# Altium schematic sheet A313_4.SchDoc
size 817 x 513 mm
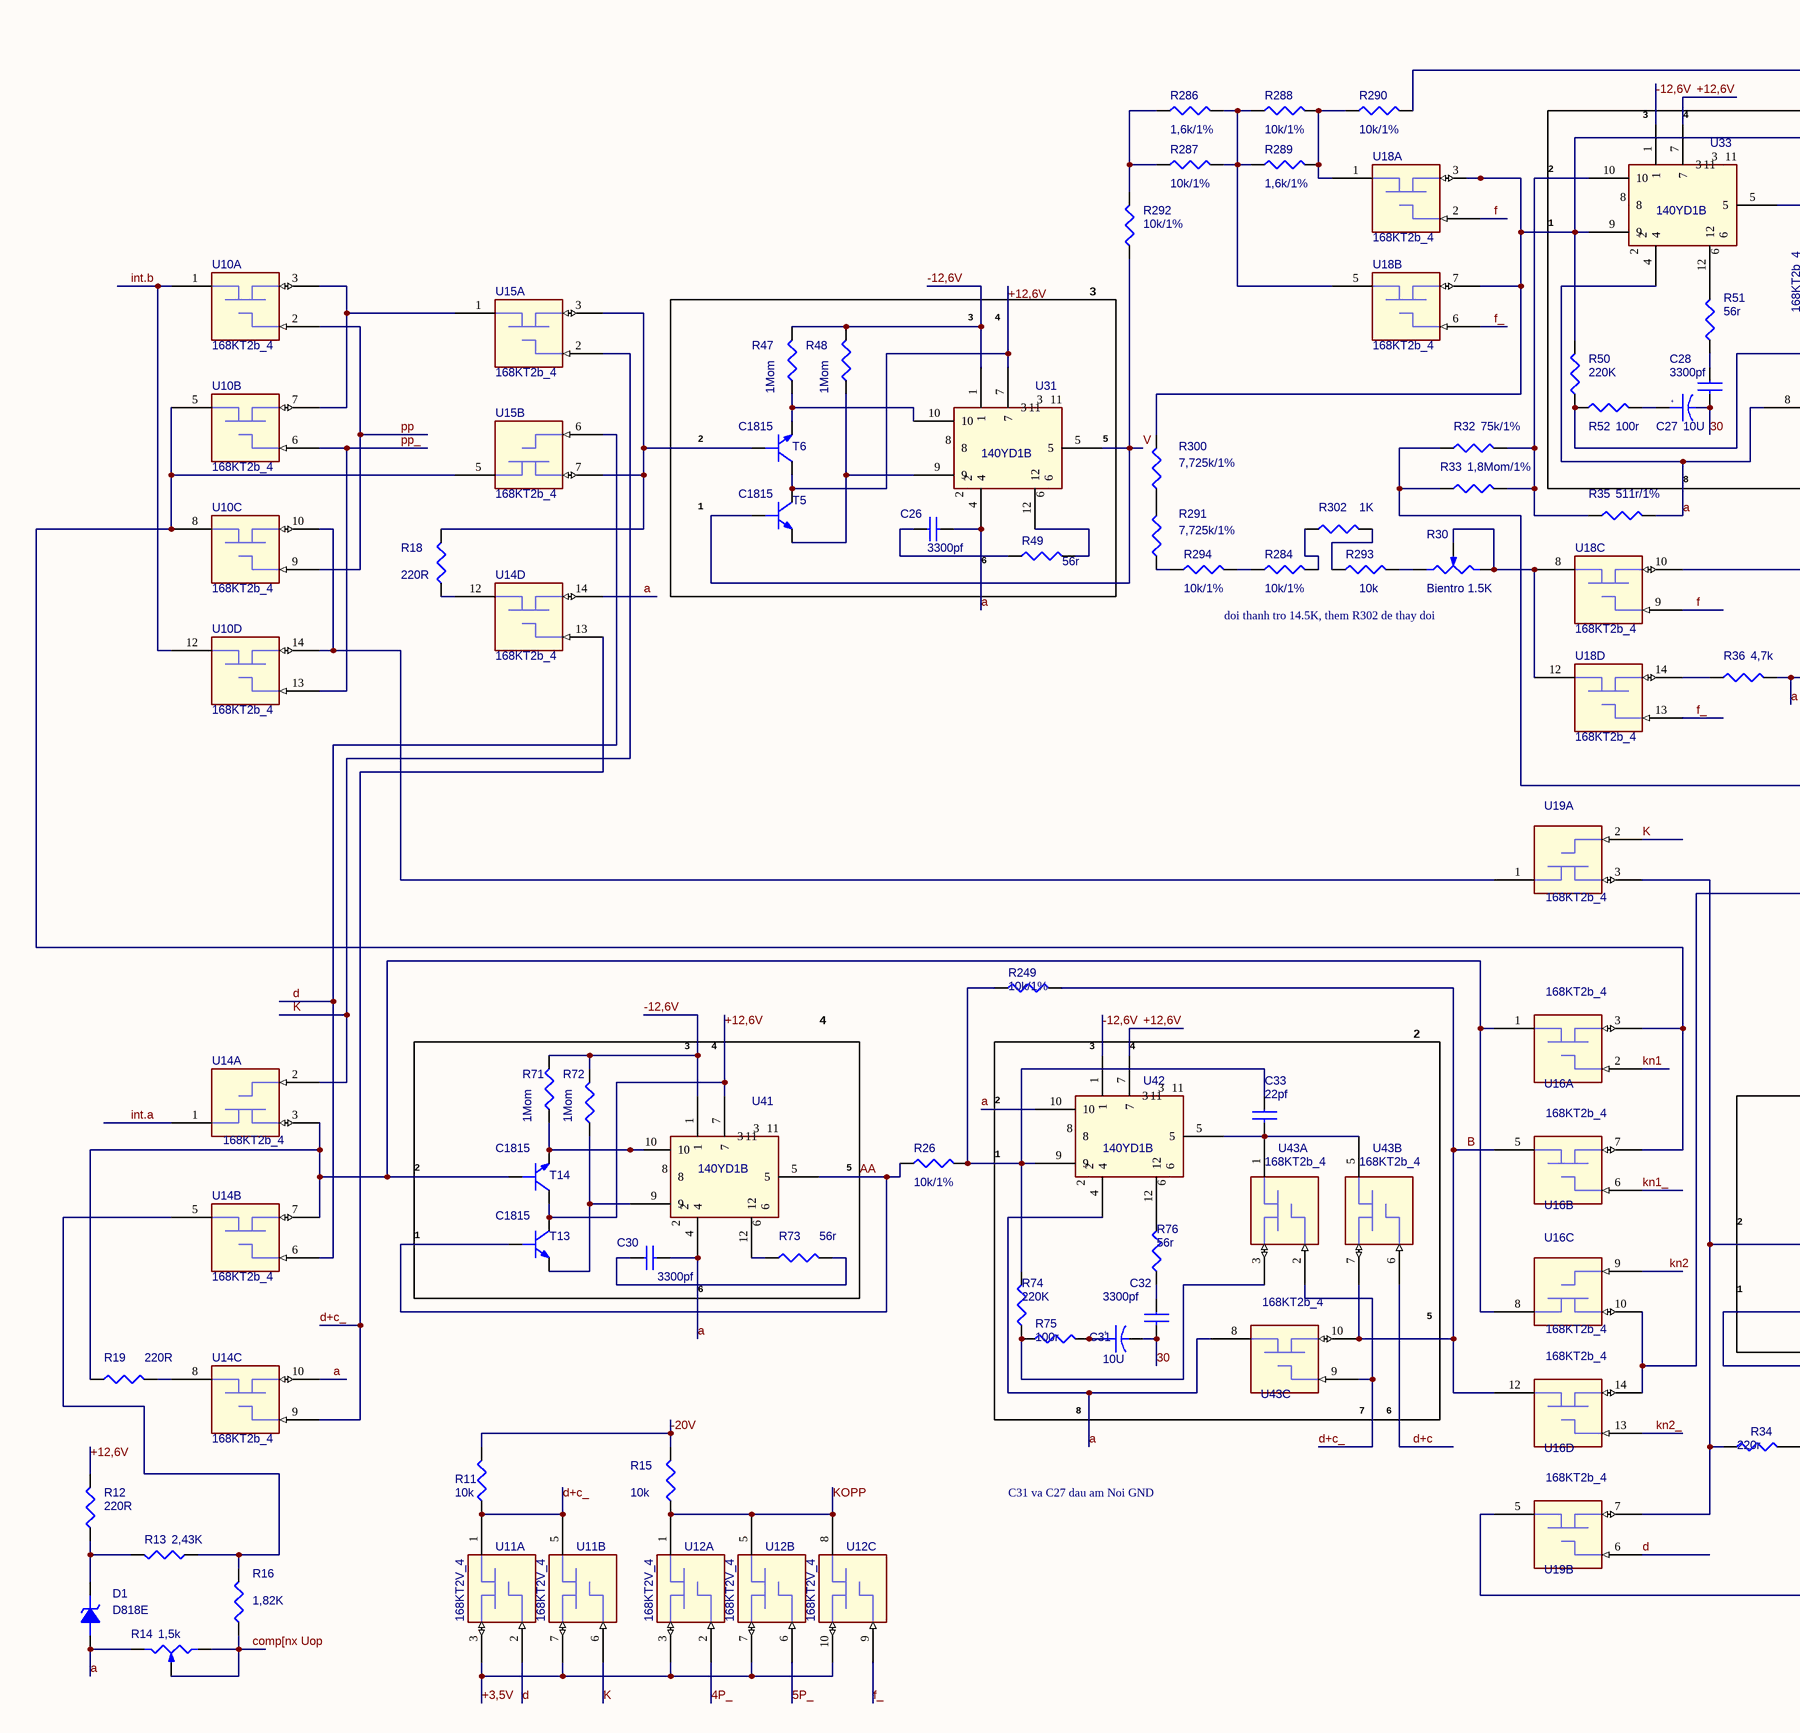
[diagram p0: A313_4.SchDoc, top left]
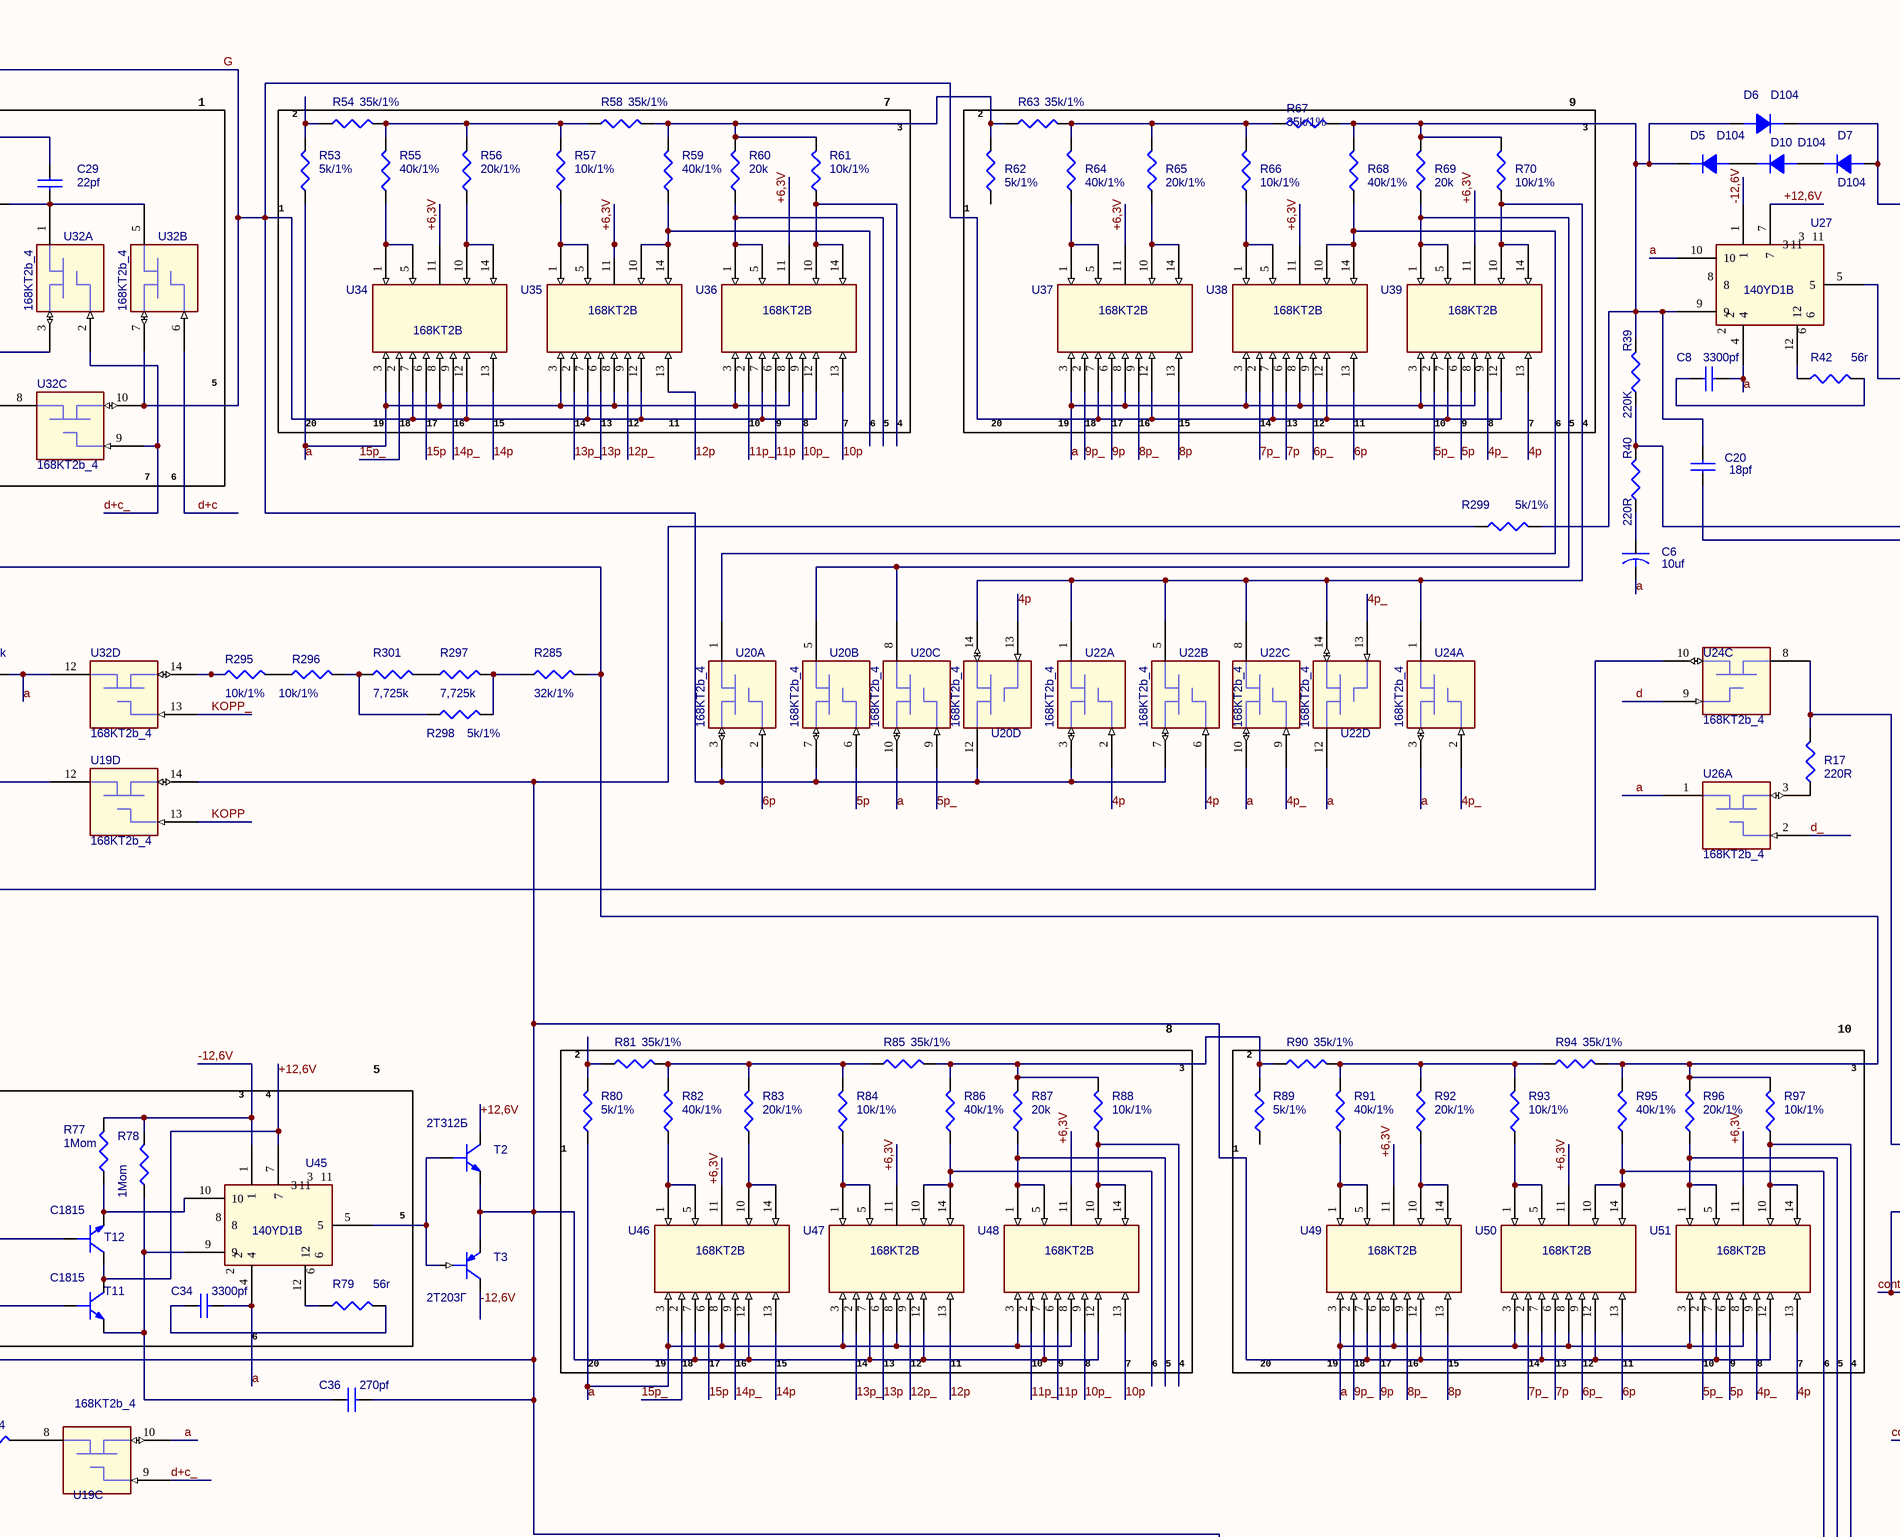
[diagram p1: A313_4.SchDoc, top middle]
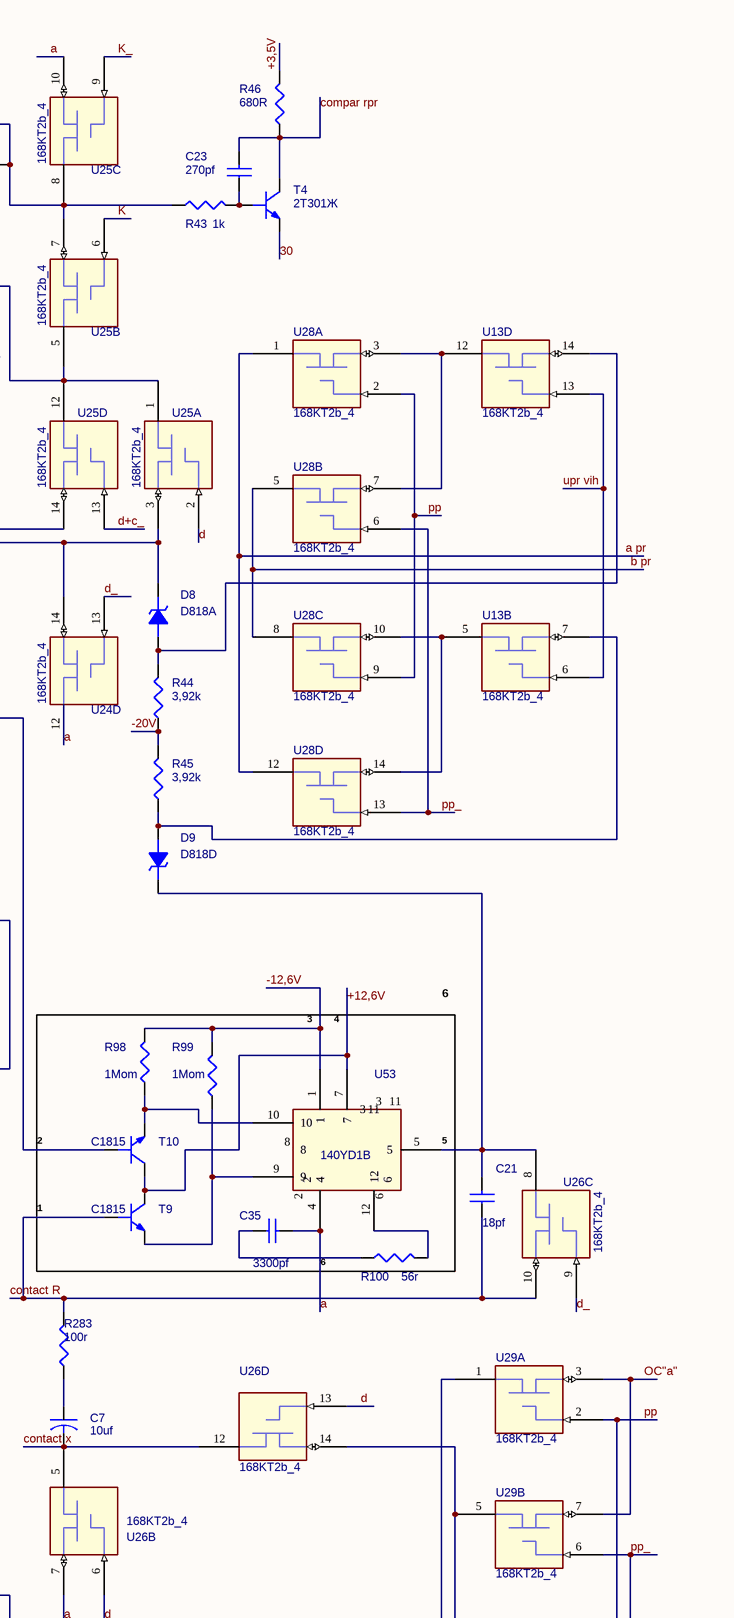
[diagram p2: A313_4.SchDoc, top right]
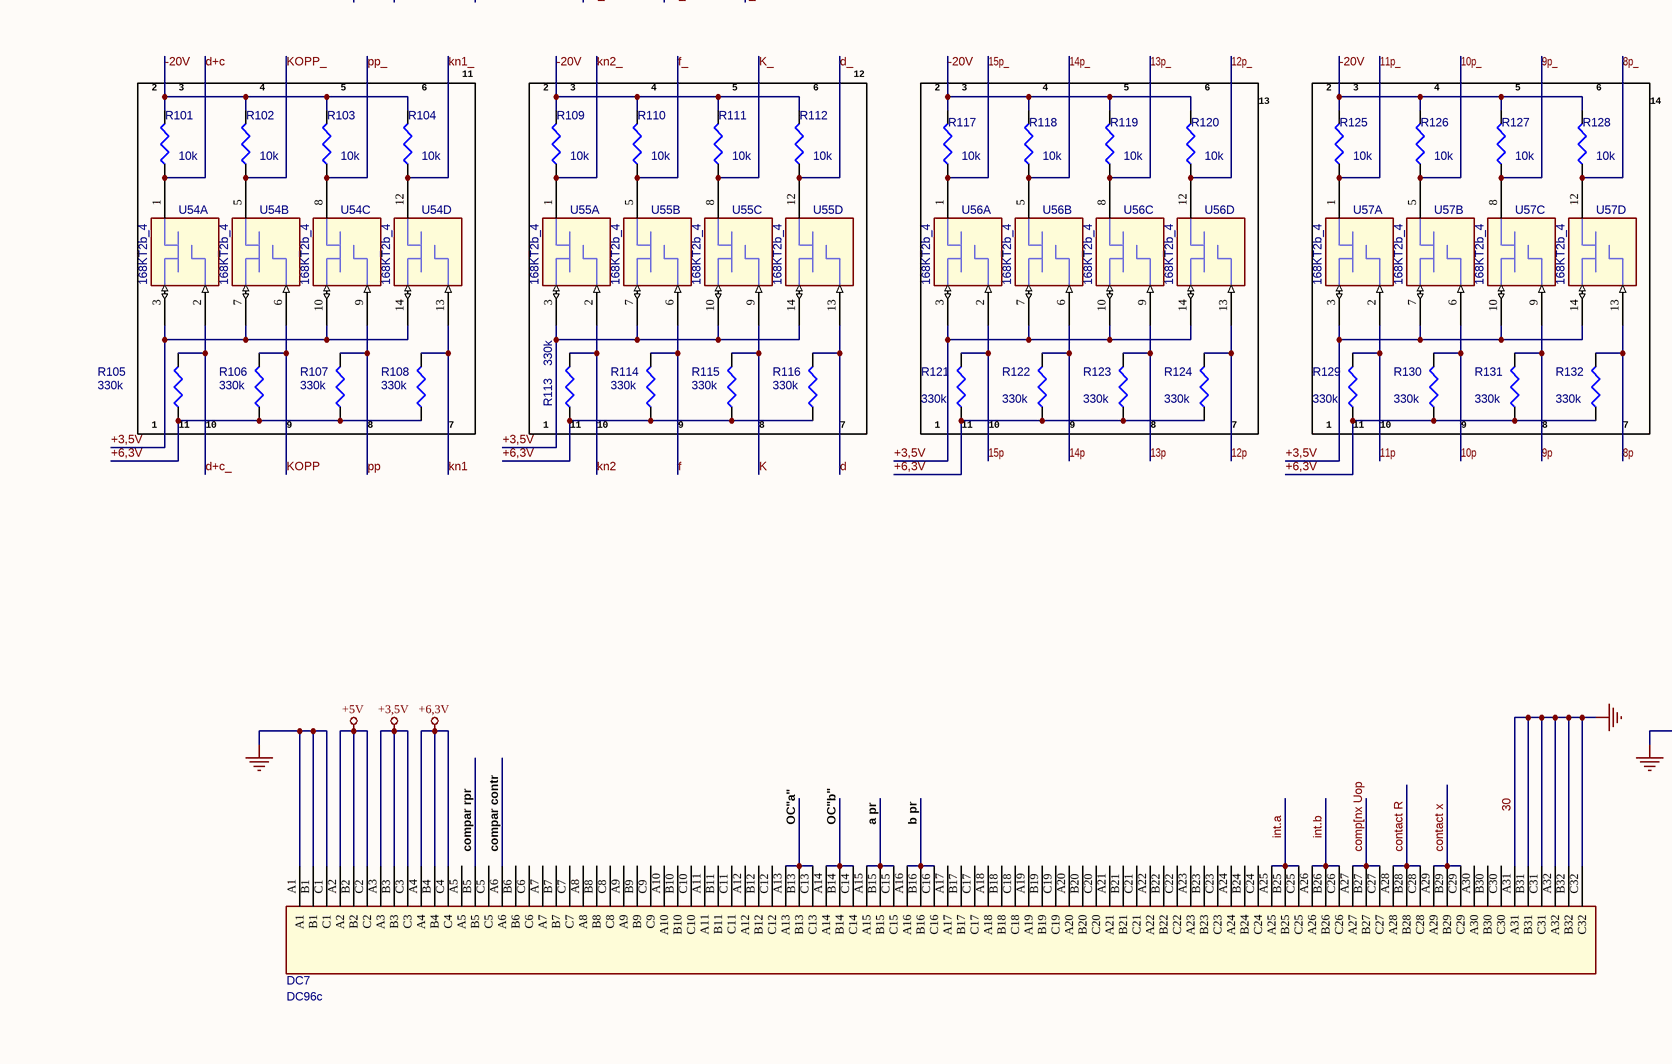
[diagram p3: A313_4.SchDoc, bottom left]
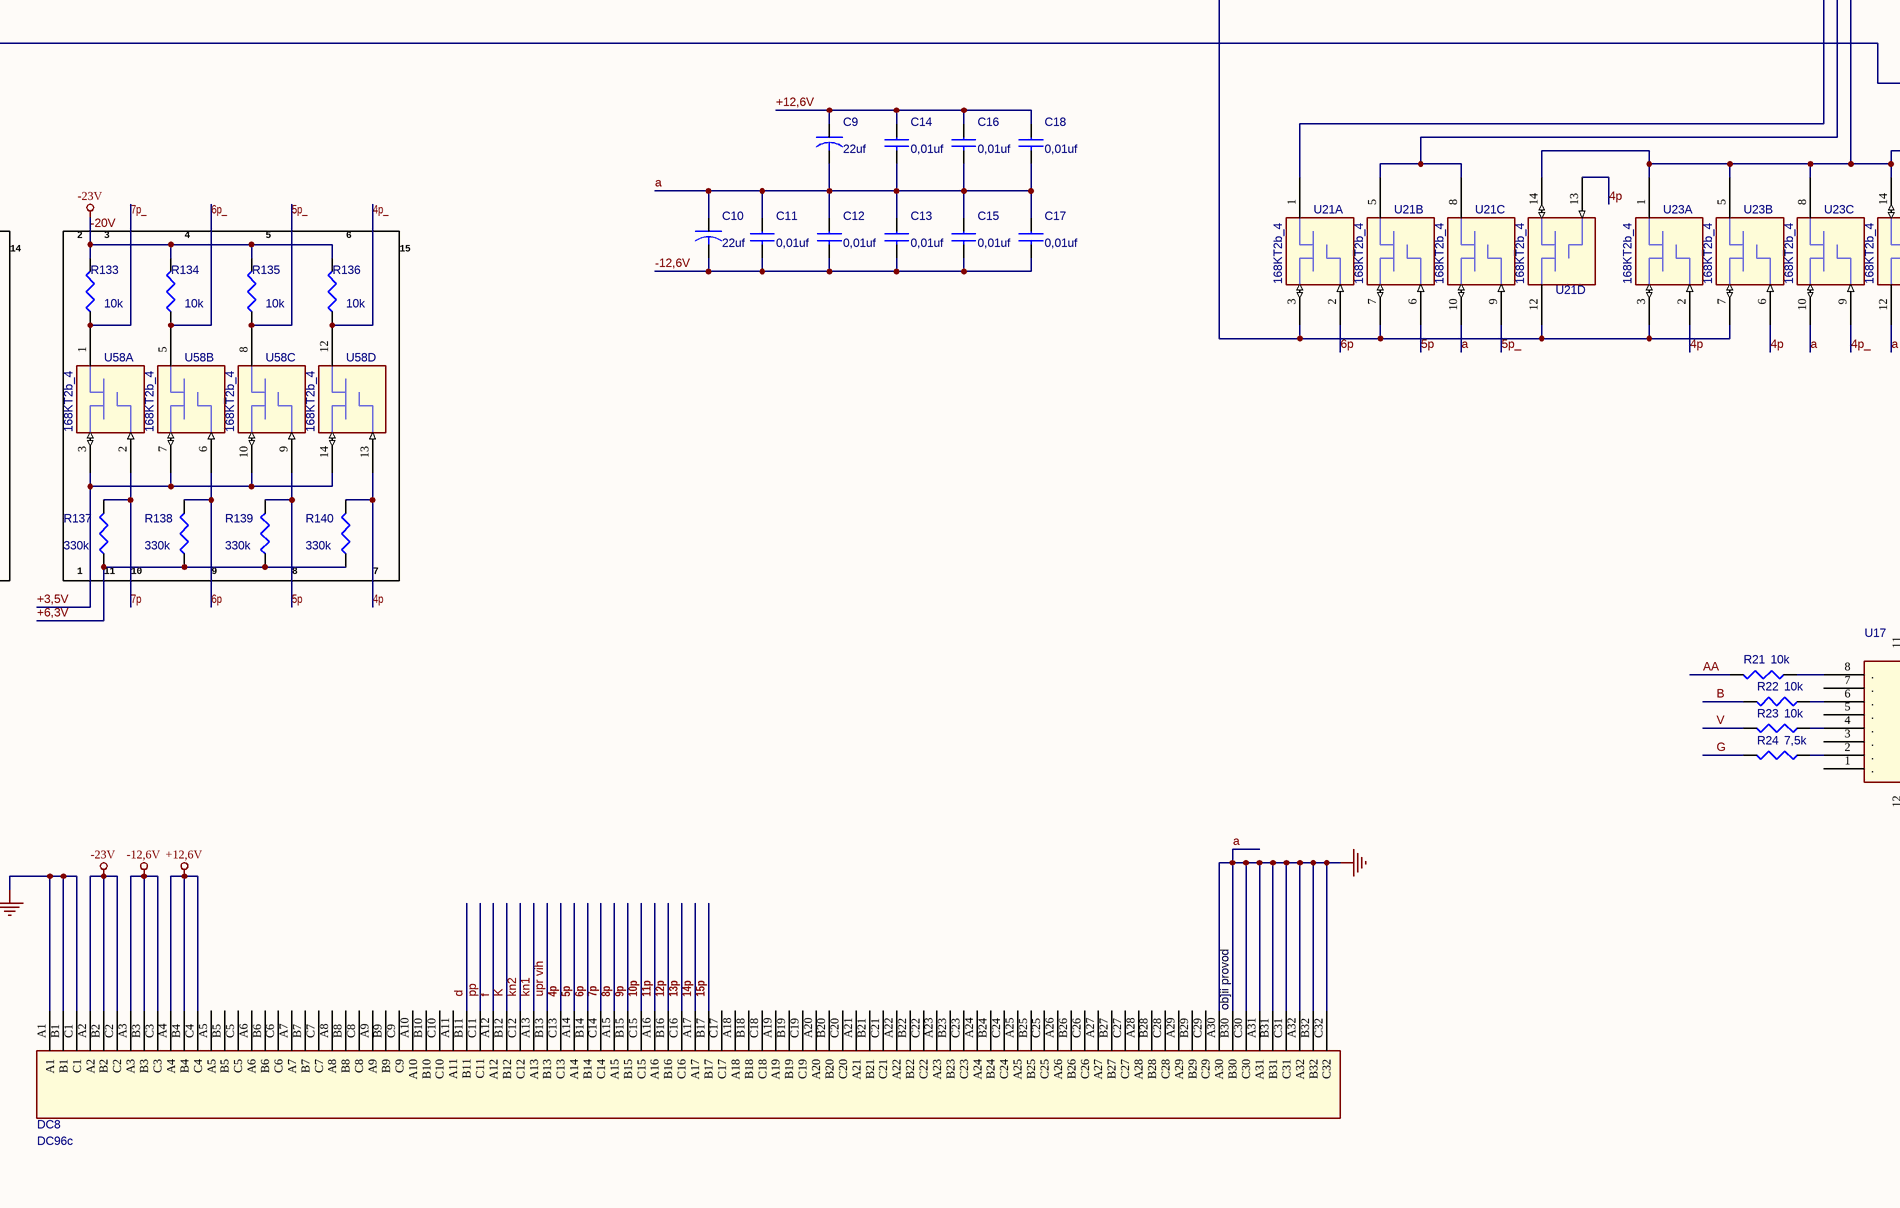
[diagram p4: A313_4.SchDoc, bottom middle]
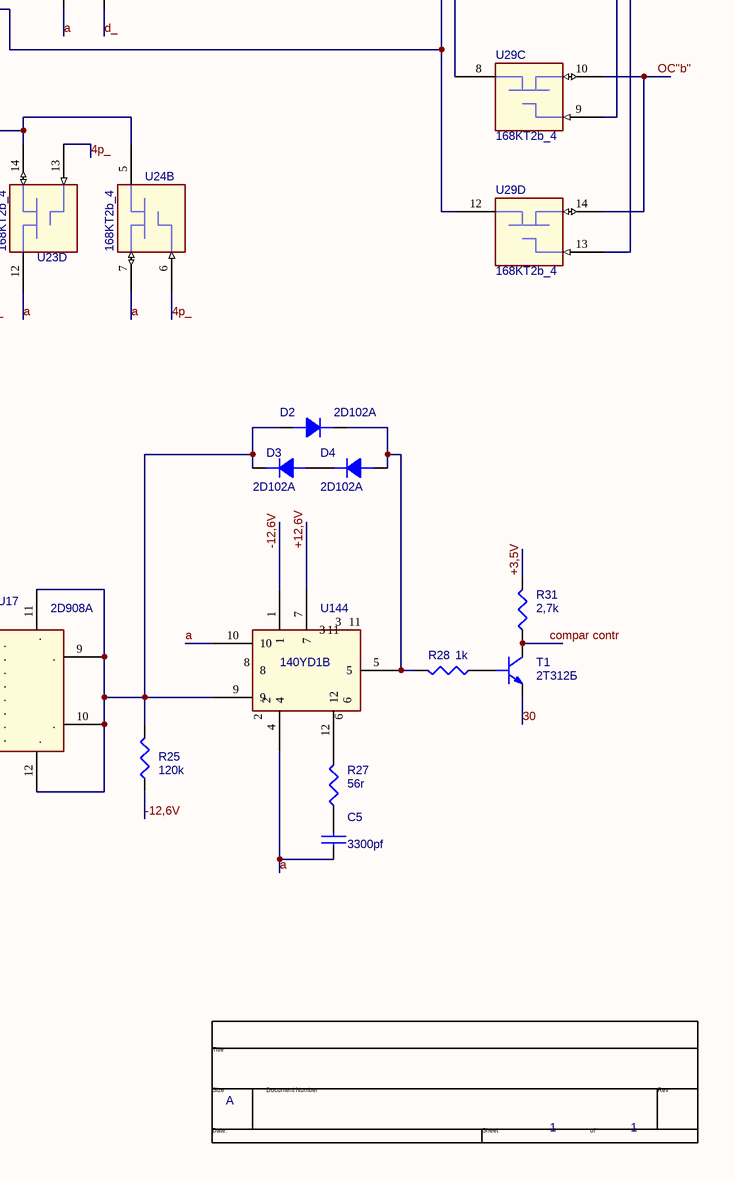
[diagram p5: A313_4.SchDoc, bottom right]

## Parts
(Parts that share a designator on the sheet are numbered #1, #2 ... from top to bottom, then left to right.)
*  Page Size: A  Page Number: 1  (hidden comment: TitleBlock0)  (graphical)
C5  3300pf  [0805]
C6  10uf  [12]
C7  10uf  [12]
C8  3300pf  [0805]
C9  22uf  [12]
C10  22uf  [12]
C11  0,01uf  [0805]
C12  0,01uf  [0805]
C13  0,01uf  [0805]
C14  0,01uf  [0805]
C15  0,01uf  [0805]
C16  0,01uf  [0805]
C17  0,01uf  [0805]
C18  0,01uf  [0805]
C20  18pf  [0805]
C21  18pf  [0805]
C23  270pf  [0805]
C26  3300pf  [0805]
C27  10U  [12]
C28  3300pf  [0805]
C29  22pf  [0805]
C30  3300pf  [0805]
C31  10U  [12]
C32  3300pf  [0805]
C33  22pf  [0805]
C34  3300pf  [0805]
C35  3300pf  [0805]
C36  270pf  [0805]
D1  D818E  [D818E]
D2  2D102A  [D104]
D3  2D102A  [D104]
D4  2D102A  [D104]
D5  D104  [D_dai]
D6  D104  [D_dai]
D7  D104  [D_dai]
D8  D818A  [D814A]
D9  D818D  [D814A]
D10  D104  [D_dai]
DC7  DC96c  [DC96c_DUC]
DC8  DC96c  [DC96c_DUC]
R11  10k  [r0805]
R12  220R  [r0805]
R13  2,43K  [r0805]
R14  1,5k  [res_var_cp5_3_3]
R15  10k  [r0805]
R16  1,82K  [r0805]
R17  220R  [r0805]
R18  220R  [r0805]
R19  220R  [r0805]
R21  10k  [r0805]
R22  10k  [r0805]
R23  10k  [r0805]
R24  7,5k  [r0805]
R25  120k  [r0805]
R26  10k/1%  [r0805]
R27  56r  [r0805]
R28  1k  [r0805]
R30  Bientro 1.5K  [res_var_cp5_3_3]
R31  2,7k  [r0805]
R32  75k/1%  [r0805]
R33  1,8Mom/1%  [r0805]
R34  220r  [r0805]
R35  511r/1%  [r0805]
R36  4,7k  [r0805]
R39  220K  [r0805]
R40  220R  [r0805]
R42  56r  [r0805]
R43  1k  [r0805]
R44  3,92k  [r0805]
R45  3,92k  [r0805]
R46  680R  [r0805]
R47  1Mom  [r0805]
R48  1Mom  [r0805]
R49  56r  [r0805]
R50  220K  [r0805]
R51  56r  [r0805]
R52  100r  [r0805]
R53  5k/1%  [r0805]
R54  35k/1%  [r0805]
R55  40k/1%  [r0805]
R56  20k/1%  [r0805]
R57  10k/1%  [r0805]
R58  35k/1%  [r0805]
R59  40k/1%  [r0805]
R60  20k  [r0805]
R61  10k/1%  [r0805]
R62  5k/1%  [r0805]
R63  35k/1%  [r0805]
R64  40k/1%  [r0805]
R65  20k/1%  [r0805]
R66  10k/1%  [r0805]
R67  35k/1%  [r0805]
R68  40k/1%  [r0805]
R69  20k  [r0805]
R70  10k/1%  [r0805]
R71  1Mom  [r0805]
R72  1Mom  [r0805]
R73  56r  [r0805]
R74  220K  [r0805]
R75  100r  [r0805]
R76  56r  [r0805]
R77  1Mom  [r0805]
R78  1Mom  [r0805]
R79  56r  [r0805]
R80  5k/1%  [r0805]
R81  35k/1%  [r0805]
R82  40k/1%  [r0805]
R83  20k/1%  [r0805]
R84  10k/1%  [r0805]
R85  35k/1%  [r0805]
R86  40k/1%  [r0805]
R87  20k  [r0805]
R88  10k/1%  [r0805]
R89  5k/1%  [r0805]
R90  35k/1%  [r0805]
R91  40k/1%  [r0805]
R92  20k/1%  [r0805]
R93  10k/1%  [r0805]
R94  35k/1%  [r0805]
R95  40k/1%  [r0805]
R96  20k/1%  [r0805]
R97  10k/1%  [r0805]
R98  1Mom  [r0805]
R99  1Mom  [r0805]
R100  56r  [r0805]
R101  10k  [r0805]
R102  10k  [r0805]
R103  10k  [r0805]
R104  10k  [r0805]
R105  330k  [r0805]
R106  330k  [r0805]
R107  330k  [r0805]
R108  330k  [r0805]
R109  10k  [r0805]
R110  10k  [r0805]
R111  10k  [r0805]
R112  10k  [r0805]
R113  330k  [r0805]
R114  330k  [r0805]
R115  330k  [r0805]
R116  330k  [r0805]
R117  10k  [r0805]
R118  10k  [r0805]
R119  10k  [r0805]
R120  10k  [r0805]
R121  330k  [r0805]
R122  330k  [r0805]
R123  330k  [r0805]
R124  330k  [r0805]
R125  10k  [r0805]
R126  10k  [r0805]
R127  10k  [r0805]
R128  10k  [r0805]
R129  330k  [r0805]
R130  330k  [r0805]
R131  330k  [r0805]
R132  330k  [r0805]
R133  10k  [r0805]
R134  10k  [r0805]
R135  10k  [r0805]
R136  10k  [r0805]
R137  330k  [r0805]
R138  330k  [r0805]
R139  330k  [r0805]
R140  330k  [r0805]
R249  10k/1%  [r0805]
R283  100r  [r0805]
R284  10k/1%  [r0805]
R285  32k/1%  [r0805]
R286  1,6k/1%  [r0805]
R287  10k/1%  [r0805]
R288  10k/1%  [r0805]
R289  1,6k/1%  [r0805]
R290  10k/1%  [r0805]
R291  7,725k/1%  [r0805]
R292  10k/1%  [r0805]
R293  10k  [r0805]
R294  10k/1%  [r0805]
R295  10k/1%  [r0805]
R296  10k/1%  [r0805]
R297  7,725k  [r0805]
R298  5k/1%  [r0805]
R299  5k/1%  [r0805]
R300  7,725k/1%  [r0805]
R301  7,725k  [r0805]
R302  1K  [r0805]
T1  2T312Б  [2T321B]
T2  2T312Б  [TZT203G]
T3  2T203Г  [t3]
T4  2T301Ж  [tzt203g]
T5  C1815  [C1815]
T6  C1815  [C1815]
T9  C1815  [C1815]
T10  C1815  [C1815]
T11  C1815  [C1815]
T12  C1815  [C1815]
T13  C1815  [C1815]
T14  C1815  [C1815]
U10  168KT2b_4  [168KT2B-1]  (parts A,B,C,D of 4)
U11#1  168KT2V_4  [168KT2B-1]  (part A of 4)
U11#2  168KT2V_4  [168KT2B-1]  (part B of 4)
U12#1  168KT2V_4  [168KT2B-1]  (parts A,B of 4)
U12#2  168KT2V_4  [168KT2B-1]  (part C of 4)
U13#1  168KT2b_4  [168KT2B-1]  (part D of 4)
U13#2  168KT2b_4  [168KT2B-1]  (part B of 4)
U14  168KT2b_4  [168KT2B-1]  (parts A,B,C,D of 4)
U15  168KT2b_4  [168KT2B-1]  (parts A,B of 4)
U16#1  168KT2b_4  [168KT2B-1]  (part A of 4)
U16#2  168KT2b_4  [168KT2B-1]  (parts B,C,D of 4)
U17  2D908A  [2d908a]
U18  168KT2b_4  [168KT2B-1]  (parts A,B,C,D of 4)
U19  168KT2b_4  [168KT2B-1]  (parts A,B,C,D of 4)
U20  168KT2b_4  [168KT2B-1]  (parts A,B,C,D of 4)
U21#1  168KT2b_4  [168KT2B-1]  (part A of 4)
U21#2  168KT2b_4  [168KT2B-1]  (parts B,C,D of 4)
U22  168KT2b_4  [168KT2B-1]  (parts A,B,C,D of 4)
U23  168KT2b_4  [168KT2B-1]  (parts A,B,C,D of 4)
U24  168KT2b_4  [168KT2B-1]  (parts A,B,C,D of 4)
U25  168KT2b_4  [168KT2B-1]  (parts A,B,C,D of 4)
U26  168KT2b_4  [168KT2B-1]  (parts A,B,C,D of 4)
U27  140YD1B  [140yd]
U28  168KT2b_4  [168KT2B-1]  (parts A,B,C,D of 4)
U29  168KT2b_4  [168KT2B-1]  (parts A,B,C,D of 4)
U31  140YD1B  [140yd]
U32#1  168KT2b_4  [168KT2B-1]  (part A of 4)
U32#2  168KT2b_4  [168KT2B-1]  (parts B,C,D of 4)
U33  140YD1B  [140yd]
U34  168KT2B  [168KT2B-1]
U35  168KT2B  [168KT2B-1]
U36  168KT2B  [168KT2B-1]
U37  168KT2B  [168KT2B-1]
U38  168KT2B  [168KT2B-1]
U39  168KT2B  [168KT2B-1]
U41  140YD1B  [140yd]
U42  140YD1B  [140yd]
U43  168KT2b_4  [168KT2B-1]  (parts A,B,C of 4)
U45  140YD1B  [140yd]
U46  168KT2B  [168KT2B-1]
U47  168KT2B  [168KT2B-1]
U48  168KT2B  [168KT2B-1]
U49  168KT2B  [168KT2B-1]
U50  168KT2B  [168KT2B-1]
U51  168KT2B  [168KT2B-1]
U53  140YD1B  [140yd]
U54  168KT2b_4  [168KT2B-1]  (parts A,B,C,D of 4)
U55  168KT2b_4  [168KT2B-1]  (parts A,B,C,D of 4)
U56  168KT2b_4  [168KT2B-1]  (parts A,B,C,D of 4)
U57  168KT2b_4  [168KT2B-1]  (parts A,B,C,D of 4)
U58#1  168KT2b_4  [168KT2B-1]  (parts A,C,D of 4)
U58#2  168KT2b_4  [168KT2B-1]  (part B of 4)
U144  140YD1B  [140yd]

## Blocks framed on the sheet
1: C27-C29 R50-R52 U32#1 U32#2 U33
7: R53-R61 U34-U36
9: R62-R70 U37-U39
3: C26 R47-R49 T5 T6 U31
4: C30 R71-R73 T13 T14 U41
2: C31-C33 R74-R76 U42 U43
6: C35 R98-R100 T9 T10 U53
8: R80-R88 U46-U48
10: R89-R97 U49-U51
5: C34 R77-R79 T11 T12 U45

## Nets
30: C5.1 C6.2 C8.2 C9.2 C10.1 C11.1 C12.1 C13.1 C14.2 C15.1 C16.2 C17.1 C18.2 C26.2 C27.2 C28.2 C30.2 C31.2 C32.2 C34.2 C35.2 D1.1(ANODE) DC7.A1 DC7.A31 DC7.A32 DC7.B1 DC7.B31 DC7.B32 DC7.C1 DC7.C31 DC7.C32 DC8.A1 DC8.A30 DC8.A31 DC8.A32 DC8.B1 DC8.B30 DC8.B31 DC8.B32 DC8.C1 DC8.C30 DC8.C31 DC8.C32 R14.3(B) R35.2 R36.2 R53.1 R80.1 T1.2(E) T4.2(E) U14.10(B) U14.14(B) U19.10(B) U20.10(B) U21#2.10(B) U22.10(B) U22.12(A) U23.10(B) U23.12(A) U24.3(B) U24.7(B) U24.12(A) U25.10(B) U26.1(A) U26.7(B) U27.4 U27.10 U31.4 U32#2.8(A) U32#2.12(A) U33.4 U34.3 U34.8 U35.3 U35.8 U36.3 U36.8 U37.3 U37.8 U38.3 U38.8 U39.3 U39.8 U41.4 U42.4 U42.10 U43.8(A) U45.4 U46.3 U46.8 U47.3 U47.8 U48.3 U48.8 U49.3 U49.8 U50.3 U50.8 U51.3 U51.8 U53.4 U144.4 U144.10  [also labelled a, GND, ob]ii provod]
+3,5V: DC7.A3 DC7.B3 DC7.C3 R31.2 R46.2 U11#1.3(B) U11#1.11(+3,5V) U11#2.7(B) U11#2.11(+3,5V) U12#1.3(B) U12#1.7(B) U12#1.11(+3,5V) U12#2.10(B) U12#2.11(+3,5V) U54.3(B) U54.7(B) U54.10(B) U54.11(+3,5V) U54.14(B) U55.3(B) U55.7(B) U55.10(B) U55.11(+3,5V) U55.14(B) U56.3(B) U56.7(B) U56.10(B) U56.11(+3,5V) U56.14(B) U57.3(B) U57.7(B) U57.10(B) U57.11(+3,5V) U57.14(B) U58#1.3(B) U58#1.10(B) U58#1.11(+3,5V) U58#1.14(B) U58#2.7(B) U58#2.11(+3,5V)
+5V: DC7.A2 DC7.B2 DC7.C2
+6,3V: DC7.A4 DC7.B4 DC7.C4 R105.1 R106.1 R107.1 R108.1 R113.1 R114.1 R115.1 R116.1 R121.1 R122.1 R123.1 R124.1 R129.1 R130.1 R131.1 R132.1 R137.1 R138.1 R139.1 R140.1 U10.11(+6,3V) U13#1.11(+6,3V) U13#2.11(+6,3V) U14.11(+6,3V) U15.11(+6,3V) U16#1.11(+6,3V) U16#2.11(+6,3V) U18.11(+6,3V) U19.11(+6,3V) U20.11(+6,3V) U21#1.11(+6,3V) U21#2.11(+6,3V) U22.11(+6,3V) U23.11(+6,3V) U24.11(+6,3V) U25.11(+6,3V) U26.11(+6,3V) U28.11(+6,3V) U29.11(+6,3V) U32#1.11(+6,3V) U32#2.11(+6,3V) U34.11(+3,5V) U35.11(+3,5V) U36.11(+3,5V) U37.11(+3,5V) U38.11(+3,5V) U39.11(+3,5V) U43.11(+6,3V) U46.11(+3,5V) U47.11(+3,5V) U48.11(+3,5V) U49.11(+3,5V) U50.11(+3,5V) U51.11(+3,5V)
+12,6V: C9.1 C14.1 C16.1 C18.1 DC8.A4 DC8.B4 DC8.C4 R12.2 T2.2(C) T5.2(C) T6.2(C) T9.2(C) T10.2(C) T11.2(C) T12.2(C) T13.2(C) T14.2(C) U27.7 U31.7 U33.7 U41.7 U42.7 U45.7 U53.7 U144.7
-12,6V: C10.2 C11.2 C12.2 C13.2 C15.2 C17.2 DC8.A3 DC8.B3 DC8.C3 R25.1 R47.2 R48.2 R71.2 R72.2 R77.2 R78.2 R98.2 R99.2 T3.3(COLLECTOR) U27.1 U31.1 U33.1 U41.1 U42.1 U45.1 U53.1 U144.1
-20V: DC8.A2 DC8.B2 DC8.C2 R11.2 R15.2 R44.1 R45.2 R101.2 R102.2 R103.2 R104.2 R109.2 R110.2 R111.2 R112.2 R117.2 R118.2 R119.2 R120.2 R125.2 R126.2 R127.2 R128.2 R133.2 R134.2 R135.2 R136.2  [also labelled -23V]
4p: DC8.C13 R140.2 U20.13(C) U21#2.13(C) U22.2(C) U22.6(C) U23.2(C) U23.6(C) U39.13 U51.13 U58#1.13(C)
4p_: R136.1 U12#1.2(C) U22.9(C) U22.13(C) U23.9(C) U23.13(C) U24.2(C) U24.6(C) U39.9 U51.9 U58#1.12(A)
5p: DC8.A14 R139.2 U20.6(C) U21#2.6(C) U39.6 U51.6 U58#1.9(C)
5p_: R135.1 U12#1.6(C) U20.9(C) U21#2.9(C) U39.2 U51.2 U58#1.8(A)
6p: DC8.B14 R138.2 U20.2(C) U21#1.2(C) U38.13 U50.13 U58#2.6(C)
6p_: R134.1 U38.9 U50.9 U58#2.5(A)
7p: DC8.C14 R137.2 U38.6 U50.6 U58#1.2(C)
7p_: R133.1 U38.2 U50.2 U58#1.1(A)
8p: DC8.A15 R132.2 U37.13 U49.13 U57.13(C)
8p_: R128.1 U37.9 U49.9 U57.12(A)
9p: DC8.B15 R131.2 U37.6 U49.6 U57.9(C)
9p_: R127.1 U37.2 U49.2 U57.8(A)
10p: DC8.C15 R130.2 U36.13 U48.13 U57.6(C)
10p_: R126.1 U36.9 U48.9 U57.5(A)
11p: DC8.A16 R129.2 U36.6 U48.6 U57.2(C)
11p_: R125.1 U36.2 U48.2 U57.1(A)
12p: DC8.B16 R124.2 U35.13 U47.13 U56.13(C)
12p_: R120.1 U35.9 U47.9 U56.12(A)
13p: DC8.C16 R123.2 U35.6 U47.6 U56.9(C)
13p_: R119.1 U35.2 U47.2 U56.8(A)
14p: DC8.A17 R122.2 U34.13 U46.13 U56.6(C)
14p_: R118.1 U34.9 U46.9 U56.5(A)
15p: DC8.B17 R121.2 U34.6 U46.6 U56.2(C)
15p_: R117.1 U34.2 U46.2 U56.1(A)
a pr: DC7.A15 DC7.B15 DC7.C15 U28.1(A) U28.12(A)
AA: R21.2 R26.1 T13.1(B) U41.5
B: R22.2 R249.2 U16#2.5(A) U16#2.12(A) U43.7(B) U43.10(B)
b pr: DC7.A16 DC7.B16 DC7.C16 U28.5(A) U28.8(A)
comp[nx Uop: DC7.A27 DC7.B27 DC7.C27 R14.1(A) R14.2(WIPER) R16.1
compar contr: DC7.A6 R31.1 T1.3(C)
compar rpr: C23.2 DC7.B5 R46.1 T4.3(C)
contact R: C21.1 DC7.A28 DC7.B28 DC7.C28 R283.2 T9.1(B) U26.10(B)
contact x: C7.2 DC7.A29 DC7.B29 DC7.C29 U26.5(A) U26.12(A)
d: DC8.B11 R116.2 U11#1.2(C) U14.6(C) U15.6(C) U19.6(C) U24.9(C) U25.2(C) U26.13(C) U55.13(C)
d+c: R101.1 U32#2.6(C) U43.6(C) U54.1(A)
d+c_: R11.1 R105.2 U11#1.1(A) U11#2.5(A) U14.9(C) U14.13(C) U19.9(C) U25.13(C) U32#1.2(C) U32#2.9(C) U43.2(C) U43.9(C) U54.2(C)
d_: R112.1 U24.13(C) U26.2(C) U26.6(C) U26.9(C) U55.12(A)
f: DC8.A12 R114.2 U18.2(C) U18.9(C) U55.6(C)
f_: R110.1 U12#2.9(C) U18.6(C) U18.13(C) U55.5(A)
G: R24.2 R290.2 U20.3(B) U20.7(B) U20.12(A) U22.3(B) U22.7(B) U32#2.7(B) U32#2.10(B) U34.7 U34.12 U35.7 U35.12 U36.7 U36.12 U37.7 U37.12 U38.7 U38.12 U39.7 U39.12
int.a: DC7.A25 DC7.B25 DC7.C25 U14.1(A)
int.b: DC7.A26 DC7.B26 DC7.C26 U10.1(A) U10.12(A)
K: DC8.B12 R115.2 U11#2.6(C) U14.2(C) U15.2(C) U19.2(C) U25.6(C) U55.9(C)
K_: R111.1 U25.9(C) U55.8(A)
kn1: DC8.A13 R108.2 U16#1.2(C) U54.13(C)
kn1_: R104.1 U16#2.6(C) U54.12(A)
kn2: DC8.C12 R113.2 U16#2.9(C) U55.2(C)
kn2_: R109.1 U16#2.13(C) U55.1(A)
KOPP: R15.1 R106.2 U12#1.1(A) U12#1.5(A) U12#2.8(A) U19.13(C) U54.6(C)
KOPP_: R102.1 U32#2.13(C) U54.5(A)
OC"a": DC7.A13 DC7.B13 DC7.C13 U29.3(B) U29.7(B)
OC"b": DC7.A14 DC7.B14 DC7.C14 U29.10(B) U29.14(B)
pp: DC8.C11 R107.2 U10.2(C) U10.9(C) U28.2(C) U28.9(C) U29.2(C) U29.9(C) U54.9(C)
pp_: R103.1 U10.6(C) U10.13(C) U28.6(C) U28.13(C) U29.6(C) U29.13(C) U54.8(A)
upr vih: DC8.B13 U13#1.13(C) U13#2.6(C)
V: R23.2 R292.1 T5.1(B) U31.5
NetC5_2: C5.2 R27.1
NetC6_1: C6.1 R40.1
NetC7_1: C7.1 R283.1
NetC8_1: C8.1 R42.2
NetC20_1: C20.1 D8.2(CATHODE) U24.14(B) U25.3(B)
NetC20_2: C20.2 D5.2(K) D6.1(A) R39.2 R67.2 R68.2 R69.2 R70.2 R299.2 U27.9
NetC21_2: C21.2 D9.2(CATHODE) U26.8(A) U53.5
NetC23_1: C23.1 R43.2 T4.1(B)
NetC26_1: C26.1 R49.1
NetC27_1: C27.1 R52.2
NetC28_1: C28.1 R51.1
NetC29_1: C29.1 R50.2 R300.2 U18.3(B) U18.7(B) U33.9
NetC29_2: C29.2 U32#1.1(A) U32#2.5(A) U33.5
NetC30_1: C30.1 R73.2
NetC31_1: C31.1 R75.2
NetC32_1: C32.1 R76.1
NetC33_1: C33.1 R26.2 R74.2 R249.1 U42.9
NetC33_2: C33.2 U42.5 U43.1(A) U43.5(A)
NetC34_1: C34.1 R79.2
NetC35_1: C35.1 R100.1
NetC36_1: C36.1 R78.1 T11.3(E) U45.9
NetC36_2: C36.2 R299.1 T2.3(E) T3.1(EMITTER) T11.1(B) U19.14(B) U21#1.3(B) U21#2.7(B) U21#2.12(A) U23.3(B) U23.7(B) U46.7 U46.12 U47.7 U47.12 U48.7 U48.12 U49.7 U49.12 U50.7 U50.12 U51.7 U51.12
NetD1_2: D1.2(CATHODE) R12.1 R13.2
NetD2_1: D2.1(A) D3.2(K) R25.2 U17.9(.) U17.10(.) U17.11(.) U17.12(.) U144.9
NetD2_2: D2.2(K) D4.1(A) R28.2 U144.5
NetD3_1: D3.1(A) D4.2(K)
NetD5_1: D5.1(A) D10.2(K)
NetD6_2: D6.2(K) D7.1(A) R43.1 U25.7(B) U25.8(A)
NetD7_2: D7.2(K) D10.1(A)
NetD8_1: D8.1(ANODE) R44.2 U13#1.14(B)
NetD9_1: D9.1(ANODE) R45.1 U13#2.7(B)
NetR13_1: R13.1 R16.2 U14.5(A)
NetR17_1: R17.1 U26.3(B)
NetR17_2: R17.2 T10.1(B) U24.8(A)
NetR18_1: R18.1 U14.12(A)
NetR18_2: R18.2 T6.1(B) U15.3(B) U15.7(B)
NetR19_1: R19.1 T14.1(B) U14.3(B) U14.7(B) U16#1.1(A) U16#2.8(A)
NetR19_2: R19.2 U14.8(A)
NetR21_1: R21.1 U17.8(.)
NetR22_1: R22.1 U17.6(.)
NetR23_1: R23.1 U17.4(.)
NetR24_1: R24.1 U17.2(.)
NetR27_2: R27.2 U144.12
NetR28_1: R28.1 T1.1(B)
NetR30_1: R30.1(A) R293.2
NetR30_2: R30.2(WIPER) R30.3(B) U18.8(A) U18.12(A)
NetR32_1: R32.1 R33.1 U19.12(A)
NetR32_2: R32.2 R33.2 R35.1 U33.10
NetR34_1: R34.1 T12.1(B) U19.3(B) U19.7(B)
NetR34_2: R34.2 U19.8(A)
NetR36_1: R36.1 U18.14(B)
NetR39_1: R39.1 R40.2 U25.14(B)
NetR42_1: R42.1 U27.12
NetR47_1: R47.1 T6.3(E) U31.10
NetR48_1: R48.1 T5.3(E) U31.9
NetR49_2: R49.2 U31.12
NetR50_1: R50.1 R52.1 U32#1.3(B)
NetR51_2: R51.2 U33.12
NetR53_2: R53.2 R54.1
NetR54_2: R54.2 R55.2 R56.2 R57.2 R58.1
NetR55_1: R55.1 U34.1 U34.5
NetR56_1: R56.1 U34.10 U34.14
NetR57_1: R57.1 U35.1 U35.5
NetR58_2: R58.2 R59.2 R60.2 R61.2 R62.2 R63.1
NetR59_1: R59.1 U35.10 U35.14
NetR60_1: R60.1 U36.1 U36.5
NetR61_1: R61.1 U36.10 U36.14
NetR63_2: R63.2 R64.2 R65.2 R66.2 R67.1
NetR64_1: R64.1 U37.1 U37.5
NetR65_1: R65.1 U37.10 U37.14
NetR66_1: R66.1 U38.1 U38.5
NetR68_1: R68.1 U20.1(A) U38.10 U38.14
NetR69_1: R69.1 U20.5(A) U20.8(A) U39.1 U39.5
NetR70_1: R70.1 U20.14(B) U22.1(A) U22.5(A) U22.8(A) U22.14(B) U24.1(A) U39.10 U39.14
NetR71_1: R71.1 T14.3(E) U41.10
NetR72_1: R72.1 T13.3(E) U41.9
NetR73_1: R73.1 U41.12
NetR74_1: R74.1 R75.1 U43.3(B)
NetR76_2: R76.2 U42.12
NetR77_1: R77.1 T12.3(E) U45.10
NetR79_1: R79.1 U45.12
NetR80_2: R80.2 R81.1
NetR81_2: R81.2 R82.2 R83.2 R84.2 R85.1
NetR82_1: R82.1 U46.1 U46.5
NetR83_1: R83.1 U46.10 U46.14
NetR84_1: R84.1 U47.1 U47.5
NetR85_2: R85.2 R86.2 R87.2 R88.2 R89.2 R90.1
NetR86_1: R86.1 U47.10 U47.14
NetR87_1: R87.1 U48.1 U48.5
NetR88_1: R88.1 U48.10 U48.14
NetR90_2: R90.2 R91.2 R92.2 R93.2 R94.1
NetR91_1: R91.1 U49.1 U49.5
NetR92_1: R92.1 U49.10 U49.14
NetR93_1: R93.1 U50.1 U50.5
NetR94_2: R94.2 R95.2 R96.2 R97.2 R285.2 U18.10(B)
NetR95_1: R95.1 U21#1.1(A) U50.10 U50.14
NetR96_1: R96.1 U21#2.5(A) U21#2.8(A) U51.1 U51.5
NetR97_1: R97.1 U21#2.14(B) U23.1(A) U23.5(A) U23.8(A) U23.14(B) U24.5(A) U51.10 U51.14
NetR98_1: R98.1 T10.3(E) U53.10
NetR99_1: R99.1 T9.3(E) U53.9
NetR100_2: R100.2 U53.12
NetR284_1: R284.1 R294.2
NetR284_2: R284.2 R302.1
NetR285_1: R285.1 R297.2 R298.2
NetR286_1: R286.1 R287.1 R292.2
NetR286_2: R286.2 R287.2 R288.1 R289.1 U18.5(A)
NetR288_2: R288.2 R289.2 R290.1 U18.1(A)
NetR291_1: R291.1 R294.1
NetR291_2: R291.2 R300.1
NetR293_1: R293.1 R302.2
NetR295_1: R295.1 U32#2.14(B)
NetR295_2: R295.2 R296.1
NetR296_2: R296.2 R298.1 R301.1
NetR297_1: R297.1 R301.2
NetT2_1: T2.1(B) T3.2(BASE) U45.5
NetU10_3: U10.3(B) U10.7(B) U15.1(A)
NetU10_5: U10.5(A) U10.8(A) U15.5(A) U16#1.3(B) U16#2.7(B)
NetU10_10: U10.10(B) U10.14(B) U19.1(A)
NetU13#1_12: U13#1.12(A) U28.3(B) U28.7(B)
NetU13#2_5: U13#2.5(A) U28.10(B) U28.14(B)
NetU16#2_10: U16#2.10(B) U16#2.14(B) U24.10(B)
NetU19_5: U19.5(A) U29.1(A) U29.12(A)
NetU25_1: U25.1(A) U25.5(A) U25.12(A) U27.5
NetU26_14: U26.14(B) U29.5(A) U29.8(A)

Not connected (* = marked no-connect by the designer): DC7 A5 A7 A8 A9 A10 A11 A12 A17 A18 A19 A20 A21 A22 A23 A24 A30 B6 B7 B8 B9 B10 B11 B12 B17 B18 B19 B20 B21 B22 B23 B24 B30 C5 C6 C7 C8 C9 C10 C11 C12 C17 C18 C19 C20 C21 C22 C23 C24 C30; DC8 A5 A6 A7 A8 A9 A10 A11 A18 A19 A20 A21 A22 A23 A24 A25 A26 A27 A28 A29 B5 B6 B7 B8 B9 B10 B18 B19 B20 B21 B22 B23 B24 B25 B26 B27 B28 B29 C5 C6 C7 C8 C9 C10 C17 C18 C19 C20 C21 C22 C23 C24 C25 C26 C27 C28 C29; R62 1; R89 1; U17 1(.) 3(.) 5(.) 7(.); U27 2 3 6 8 11; U31 2 3 6 8 11; U33 2 3 6 8 11; U41 2 3 6 8 11; U42 2 3 6 8 11; U45 2 3 6 8 11; U53 2 3 6 8 11; U144 2 3 6 8 11

## Notes on the sheet
- (near U33) 3
- (near U33) 4
- 2
- 3
- 1
- (near R53) 1
- (near R62) 1
- 4
- 5
- 20
- 19
- 18
- 17
- 16
- 15
- 14
- 13
- 12
- 11
- 10
- 9
- 8
- 7
- 6
- (near U32#2) 7
- doi thanh tro 14.5K, them R302 de thay doi
- (near U42) 4
- (near R26) 1
- (near R80) 1
- (near R89) 1
- (near U43) 7
- C31 va C27 dau am Noi GND
- (near R101) 2
- (near R101) 3
- (near R102) 4
- (near R103) 5
- (near R104) 6
- (near R109) 2
- (near R109) 3
- (near R110) 4
- (near R111) 5
- (near R112) 6
- (near R117) 2
- (near R117) 3
- (near R118) 4
- (near R119) 5
- (near R120) 6
- (near R125) 2
- (near R125) 3
- (near R126) 4
- (near R127) 5
- (near R128) 6
- (near R133) 2
- (near R133) 3
- (near R134) 4
- (near R135) 5
- (near R136) 6
- (near R105) 1
- (near R105) 11
- (near R106) 9
- (near R107) 8
- (near R108) 7
- (near R113) 1
- (near R113) 11
- (near R114) 9
- (near R115) 8
- (near R116) 7
- (near R121) 1
- (near R121) 11
- (near R122) 9
- (near R123) 8
- (near R124) 7
- (near R129) 1
- (near R129) 11
- (near R130) 9
- (near R131) 8
- (near R132) 7
- (near R137) 1
- (near R137) 11
- (near R138) 9
- (near R139) 8
- (near R140) 7
- (in symbol CAP POL) +
- (in symbol TitleBlock0) Title; Size; Document Number; Rev; Date:; Sheet; of

## Library data of the parts
C5 C8 C11-C18 C20 C21 C23 C26 C28-C30 C32-C36 = CAP NP
C6 = C_0
C7 C9 C10 = C
C27 C31 = CAP POL
D1 D9 = DIODE ZENER
D2-D7 D10 = DIODE
D8 = DIODE ZENER_0
R11-R13 R15-R19 R21-R28 R31-R36 R39 R40 R42-R140 R249 R283-R302 = R
R14 R30 = RESISTOR VAR
T1 = 1R1001_4
T2 = 1R1001_2
T3 = 2N1132_1
T4 = 1R1001_5
T5 T6 T9-T14 = 1R1001_1
U11#1 = 168KT2b_22
U11#2 U12#1 U54-U57 U58#1 = 168KT2b_25
U12#2 = 168KT2b_17
U13#1 = 168KT2b_23
U16#1 = 168KT2b_24
U17 = 2D908A_1
U21#1 = 168KT2b_18
U27 U31 U33 U45 U53 U144 = 140YD1B_2
U32#1 = 168KT2b_8
U34-U39 U46-U51 = 168KT2B_13
U41 = 140YD1B_3
U42 = 140YD1B_4
U58#2 = 168KT2b_19
* = TitleBlock0: Page Create Date: March  8, 1995; Page Count: 1